# EasyEDA Pro project AHAU_CTF26_BAdge.epro

# Schematic Schematic1
Board Name: Board1; Create Date: 2026-04-05; Page Name: P1; Project Name: AHAU_CTF26; Schematic Name: Schematic1; Update Date: 2026-04-05; Company: EasyEDA.com; Page Size: A4; Version: V1.0
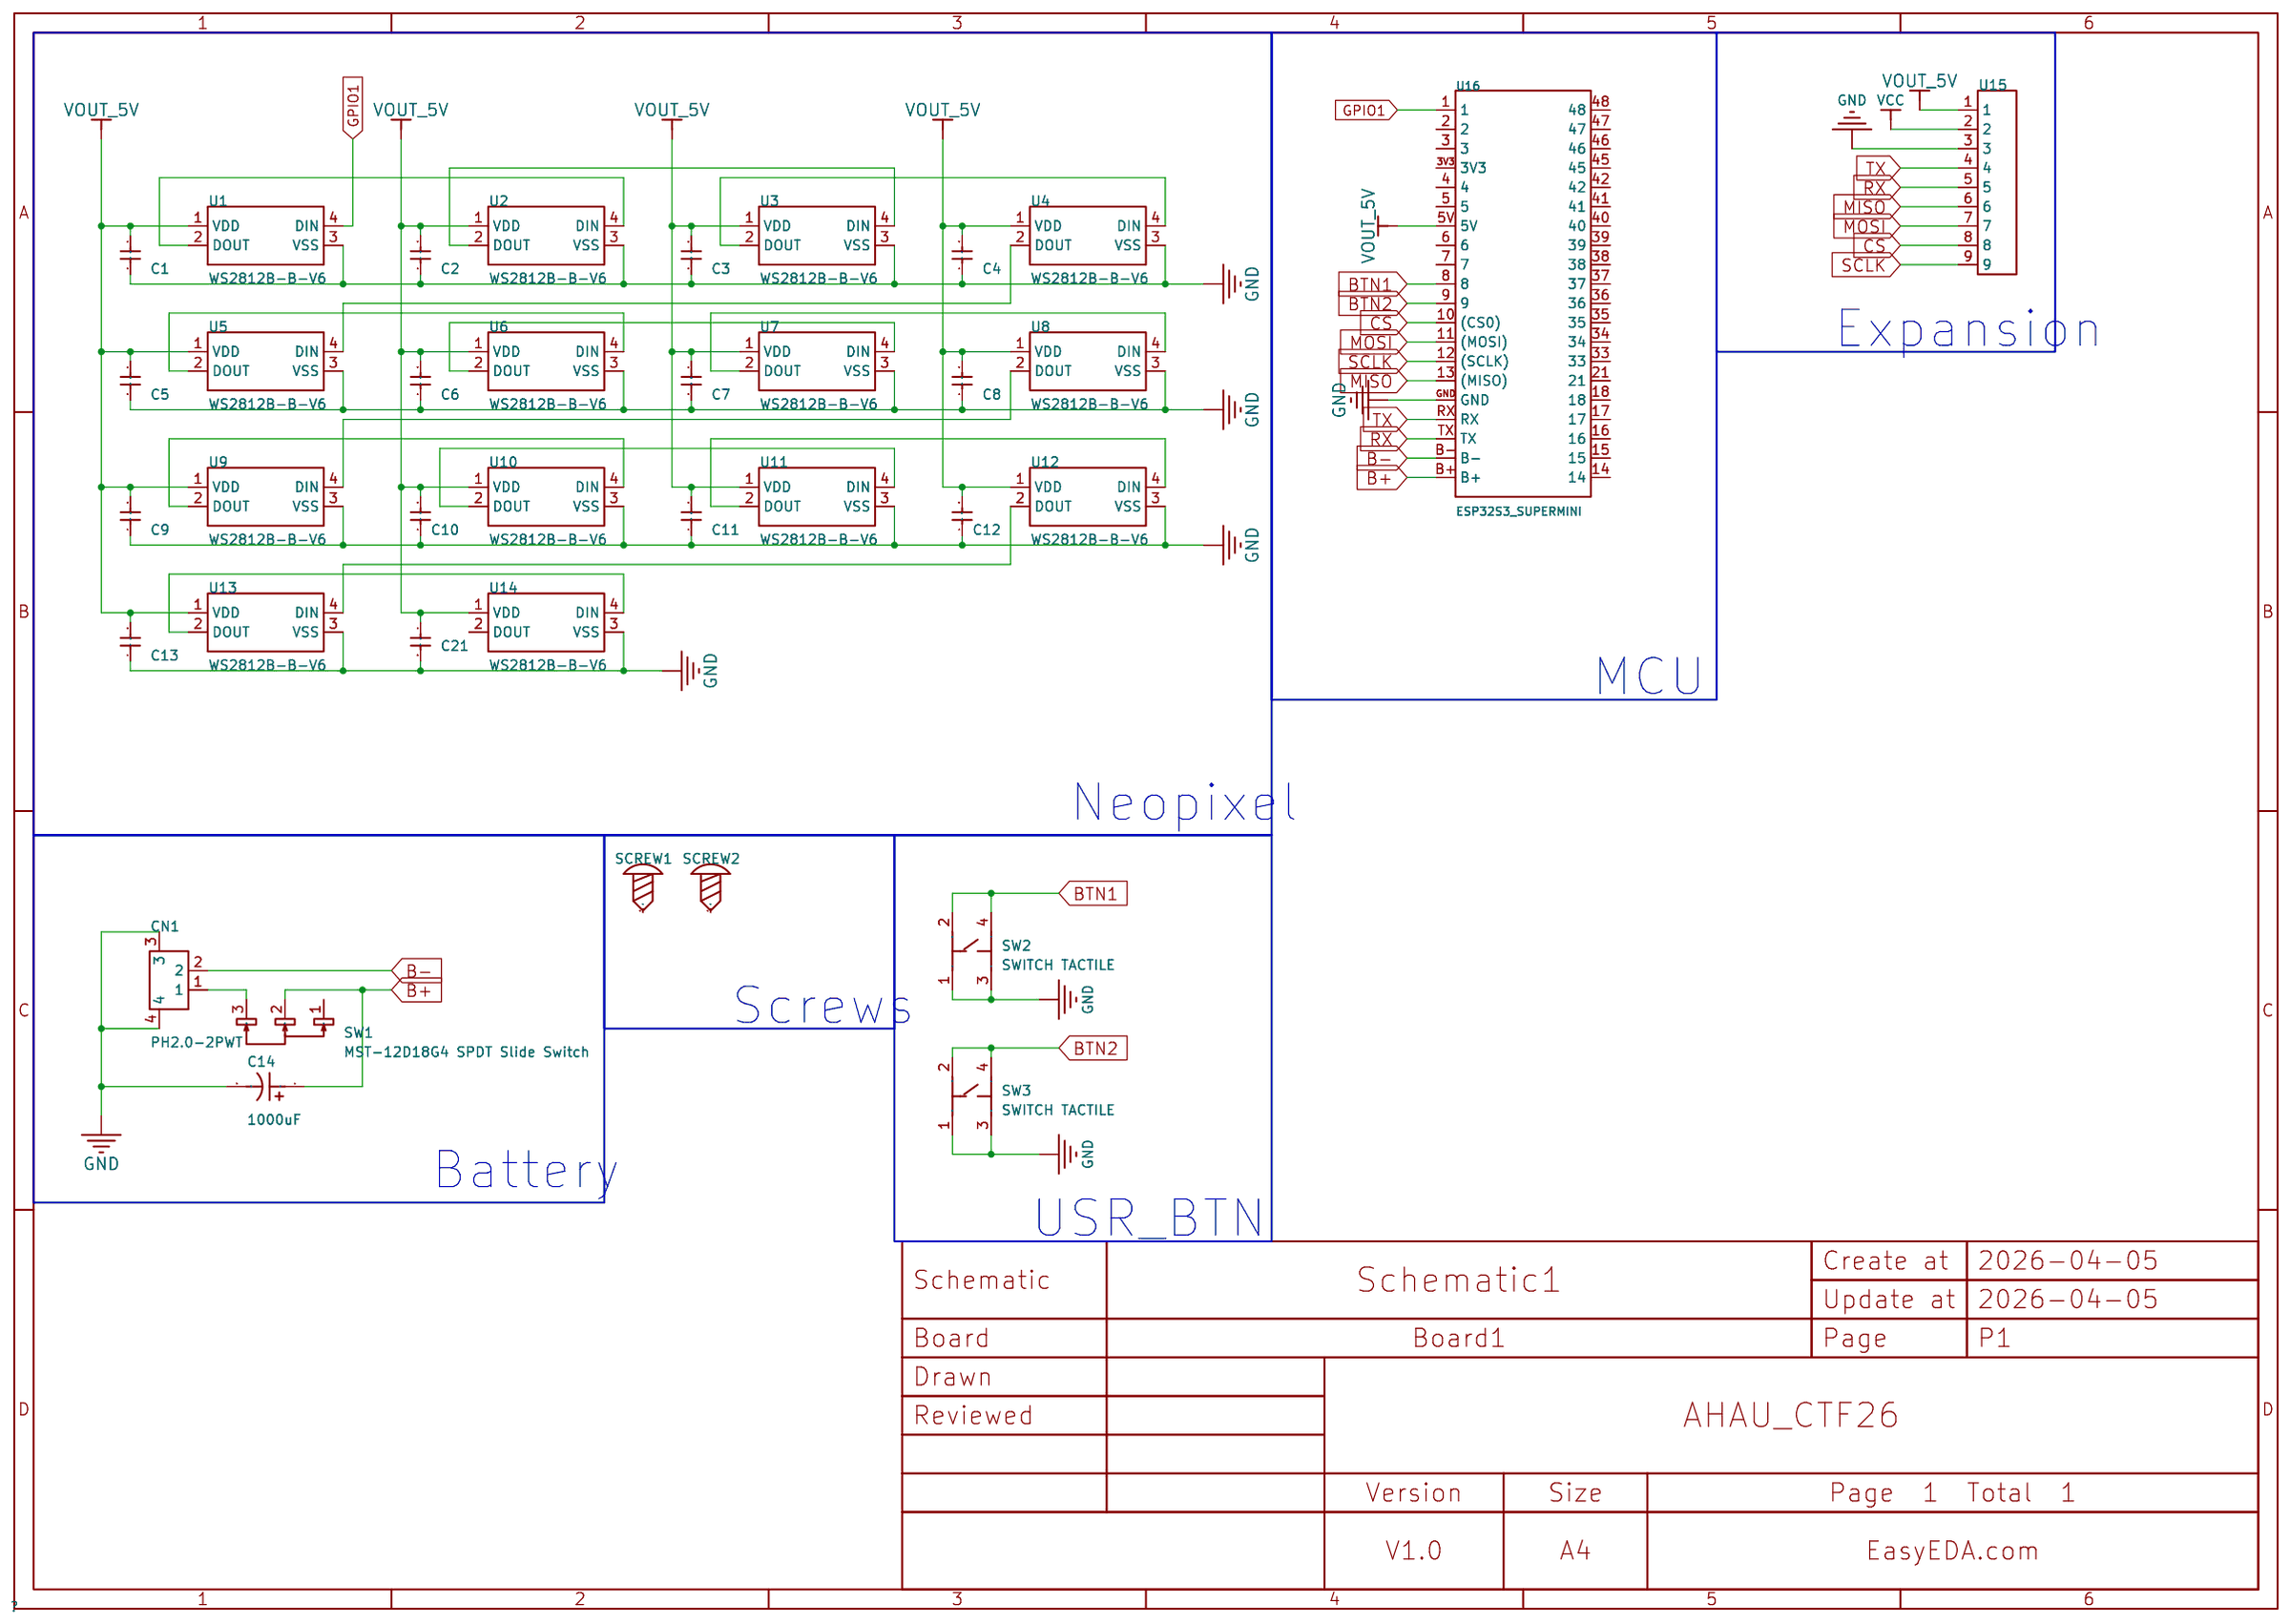
[diagram p0: schematic sheet]

## Parts
C1  1uF  [C0603]
C2  1uF  [C0603]
C3  1uF  [C0603]
C4  1uF  [C0603]
C5  1uF  [C0603]
C6  1uF  [C0603]
C7  1uF  [C0603]
C8  1uF  [C0603]
C9  1uF  [C0603]
C10  1uF  [C0603]
C11  1uF  [C0603]
C12  1uF  [C0603]
C13  1uF  [C0603]
C14  1000uF  [CAP-SMD_BD12.5-L12.8-W12.8-LS13.5-FD]
C21  1uF  [C0603]
CN1  PH2.0-2PWT  [CONN-SMD_PH2.0-2PWT]
SCREW1  -  [M3 Hole]
SCREW2  -  [M3 Hole]
SW1  MST-12D18G4 SPDT Slide Switch  [SW-SMD_MST-12D18G4-SPDT-SLIDE-SWITCH]
SW2  SWITCH TACTILE  [SW-SMD_4P-L5.2-W5.2-P3.7-LS6.4-1]
SW3  SWITCH TACTILE  [SW-SMD_4P-L5.2-W5.2-P3.7-LS6.4-1]
U1  WS2812B-B-V6  [LED-SMD_4P-L5.0-W5.0-TL_WS2812B-B]
U2  WS2812B-B-V6  [LED-SMD_4P-L5.0-W5.0-TL_WS2812B-B]
U3  WS2812B-B-V6  [LED-SMD_4P-L5.0-W5.0-TL_WS2812B-B]
U4  WS2812B-B-V6  [LED-SMD_4P-L5.0-W5.0-TL_WS2812B-B]
U5  WS2812B-B-V6  [LED-SMD_4P-L5.0-W5.0-TL_WS2812B-B]
U6  WS2812B-B-V6  [LED-SMD_4P-L5.0-W5.0-TL_WS2812B-B]
U7  WS2812B-B-V6  [LED-SMD_4P-L5.0-W5.0-TL_WS2812B-B]
U8  WS2812B-B-V6  [LED-SMD_4P-L5.0-W5.0-TL_WS2812B-B]
U9  WS2812B-B-V6  [LED-SMD_4P-L5.0-W5.0-TL_WS2812B-B]
U10  WS2812B-B-V6  [LED-SMD_4P-L5.0-W5.0-TL_WS2812B-B]
U11  WS2812B-B-V6  [LED-SMD_4P-L5.0-W5.0-TL_WS2812B-B]
U12  WS2812B-B-V6  [LED-SMD_4P-L5.0-W5.0-TL_WS2812B-B]
U13  WS2812B-B-V6  [LED-SMD_4P-L5.0-W5.0-TL_WS2812B-B]
U14  WS2812B-B-V6  [LED-SMD_4P-L5.0-W5.0-TL_WS2812B-B]
U15  -  [HDR-TH_9P-P2.54-V-M]
U16  ESP32S3_SUPERMINI  [ESP32-S3-SUPERMINI]

## Library data of the parts
C1-C13 C21 = C1uF: Capacitance:1uF Tolerance:±10% Tolerance:±10% Voltage Rated:50V Temperature Coefficient:X5R; LCSC Part Name: 1uF ±10% 50V; Supplier Part: C15849; Manufacturer: SAMSUNG(三星); Manufacturer Part: CL10A105KB8NNNC; Supplier Footprint: 0603; JLCPCB Part Class: Basic Part; Datasheet: https://atta.szlcsc.com/upload/public/pdf/source/20160103/1457707679084.pdf; Supplier: LCSC; Tolerance: ±10%; Voltage Rated: 50V; Temperature Coefficient: X5R
C14 = EDH108M025A9RAA: Capacitance:1000uF Tolerance:±20% Tolerance:±20% Voltage Rating:25V Ripple Current:510mA@120Hz Diameter:12.5mm Lifetime:2000hrs@105℃ Operating Temperature:-40℃~+105℃ Operating Temperature:-40℃~+105℃ Polarity type:有极性; LCSC Part Name: 1000uF ±20% 25V; Supplier Part: C2166241; Manufacturer: KEMET(基美); Supplier Footprint: SMD; JLCPCB Part Class: Extended Part; Datasheet: https://item.szlcsc.com/datasheet/EDH108M025A9RAA/2258293.html; Supplier: LCSC; Tolerance: ±20%; Voltage Rating: 25V; Ripple Current: 510mA@120Hz; Diameter: 12.5mm; Lifetime: 2000hrs@105℃; Operating Temperature: -40℃~+105℃; Polarity type: 有极性
CN1 = PH2.0-2PWT: Pins Structure:1x2P Pitch:2mm Mounting Type:Surface Mount, Right Angle Reference Series:PH Number of Pins:2P Number of Rows:1 Number of PINs Per Row:2 Current Rating:2A Contact Material:Brass Contact Plating:Tin Operating Temperature:-40℃~+85℃ Operating T; LCSC Part Name: 1x2P 间距:2mm 卧贴 系列:PH; Supplier Part: C52037422; Manufacturer: XUNPU(讯普); Supplier Footprint: SMD,P=2mm,卧贴; JLCPCB Part Class: Extended Part; Datasheet: https://item.szlcsc.com/datasheet/PH2.0-2PWT/54795753.html; Supplier: LCSC; Pins Structure: 1x2P; Pitch: 2mm; Mounting Type: Surface Mount, Right Angle; Reference Series: PH; Number of Pins: 2P; Number of Rows: 1; Number of PINs Per Row: 2; Current Rating: 2A; Contact Material: Brass; Contact Plating: Tin; Operating Temperature: -40℃~+85℃; Voltage Rating: 100V; Plastic Material: LCP; Flame Retardant Rating: UL94V-0; Supplementary Features: Auxiliary Solder Pin; Color: Beige; Z-Height of the Board: 5.5mm; X-Length of Bottom Edge on Board (Spacing Line): 7.9mm; Y-Width of Bottom Edge on Board: 7.6mm
SCREW1 SCREW2 = Screw-Hole-M3: Supplier Footprint: 插件
SW1 = MST-12D18G4 SPDT Slide Switch: Circuit:SPDT Actuator Style:Rectangular Columnar Termination Style:SMD(SMT) Tab Length:9.1mm Width:3.5mm Switch Height:7.5mm Mounting Type:Surface Mount, Right Angle Actuator Color:Black Current Rating:100mA Voltage Rating:12V Life:10,000 Cycles Operating; LCSC Part Name: MST-12D18G4卧式带柱编带; Supplier Part: C49023767; Manufacturer: SHOU HAN(首韩); Supplier Footprint: SMD; JLCPCB Part Class: Extended Part; Datasheet: https://item.szlcsc.com/datasheet/MST-12D18G4%2520SPDT%2520Slide%2520Switch/51384142.html; Supplier: LCSC; Circuit: SPDT; Actuator Style: Rectangular Columnar; Termination Style: SMD(SMT) Tab; Length: 9.1mm; Width: 3.5mm; Switch Height: 7.5mm; Mounting Type: Surface Mount, Right Angle; Actuator Color: Black; Current Rating: 100mA; Voltage Rating: 12V; Life: 10,000 Cycles; Operating Temperature: -25℃~+70℃
SW2 SW3 = HX 5.2x5.2x1.5H SWITCH TACTILE: Circuit:SPST Actuator Style:Round Button Operating Force:2.5N Mounting Type:Surface Mount,Vertical Length:5.2mm Width:5.2mm Switch Height:1.5mm with Bracket:Without Bracket Contact Current:50mA Voltage Rating:12V Actuator/Cap Color:Yellow With Lamp:No IP; LCSC Part Name: 5.2*5.2*1.5mm 立贴 轻触开关; Supplier Part: C49234130; Manufacturer: hanxia(韩下); Supplier Footprint: SMD; JLCPCB Part Class: Extended Part; Datasheet: https://item.szlcsc.com/datasheet/HX%25205.2x5.2x1.5H%2520SWITCH%2520TACTILE/51650191.html; Supplier: LCSC; Circuit: SPST; Actuator Style: Round Button; Operating Force: 2.5N; Mounting Type: Surface Mount,Vertical; Length: 5.2mm; Width: 5.2mm; Switch Height: 1.5mm; with Bracket: Without Bracket; Contact Current: 50mA; Voltage Rating: 12V; Actuator/Cap Color: Yellow; With Lamp: No; Termination Style: SMD(SMT) Tab; Life: 100,000 Cycles
U1-U14 = WS2812B-B-V6: Supplier Part: C52941391; Manufacturer: worldsemi; Supplier Footprint: SMD5050-4P; JLCPCB Part Class: Extended Part; Datasheet: https://item.szlcsc.com/datasheet/WS2812B-B-V6/55856754.html; Supplier: LCSC
U15 = Header9P_2.54
U16 = ESP32S3_SUPERMINI: esp32 s3 supermini with all of the pins; link: https://www.aliexpress.com/item/1005006838192160.html?src=google&src=google&albch=shopping&acnt=494-037-6276&isdl=y&slnk=&plac=&mtctp=&albbt=Google_7_shopping&aff_platform=google&aff_short_key=UneMJZVf&gclsrc=aw.ds&&albagn=888888&&ds_e_adid=&ds_e_matchtype=&ds_e_device=c&ds_e_network=x&ds_e_product_group_id=&ds_e_product_id=en1005006838192160&ds_e_product_merchant_id=106274268&ds_e_product_country=GB&ds_e_product_language=en&ds_e_product_channel=online&ds_e_product_store_id=&ds_url_v=2&albcp=17859500389&albag=&isSmbAutoCall=false&needSmbHouyi=false&gad_source=1&gclid=CjwKCAjw_4S3BhAAEiwA_64Yhu-4cWOcr4zIoMMT86tg_DvZlKA97rwpv0V6Q1grb6KFBap-yB5T3hoCvMkQAvD_BwE

## Nets
GND: C1.1 C2.1 C3.1 C4.1 C5.1 C6.1 C7.1 C8.1 C9.1 C10.1 C11.1 C12.1 C13.1 C14.2 C21.2 CN1.3 CN1.4 SW2.1 SW2.3 SW3.1 SW3.3 U1.3(VSS) U2.3(VSS) U3.3(VSS) U4.3(VSS) U5.3(VSS) U6.3(VSS) U7.3(VSS) U8.3(VSS) U9.3(VSS) U10.3(VSS) U11.3(VSS) U12.3(VSS) U13.3(VSS) U14.3(VSS) U15.3 U16.GND
VCC: U15.2
B+: C14.1 SW1.2 U16.B+
B-: CN1.2 U16.B-
BTN1: SW2.2 SW2.4 U16.8
BTN2: SW3.2 SW3.4 U16.9
CS: U15.8 U16.10((CS0))
GPIO1: U1.4(DIN) U16.1
MISO: U15.6 U16.13((MISO))
MOSI: U15.7 U16.11((MOSI))
RX: U15.5 U16.TX
SCLK: U15.9 U16.12((SCLK))
TX: U15.4 U16.RX
VOUT_5V: C1.2 C2.2 C3.2 C4.2 C5.2 C6.2 C7.2 C8.2 C9.2 C10.2 C11.2 C12.2 C13.2 C21.1 U1.1(VDD) U2.1(VDD) U3.1(VDD) U4.1(VDD) U5.1(VDD) U6.1(VDD) U7.1(VDD) U8.1(VDD) U9.1(VDD) U10.1(VDD) U11.1(VDD) U12.1(VDD) U13.1(VDD) U14.1(VDD) U15.1 U16.5V
$1N5915: U12.2(DOUT) U13.4(DIN)
$1N5955: U1.2(DOUT) U2.4(DIN)
$1N6010: U2.2(DOUT) U3.4(DIN)
$1N6017: U3.2(DOUT) U4.4(DIN)
$1N6025: U4.2(DOUT) U5.4(DIN)
$1N6060: U5.2(DOUT) U6.4(DIN)
$1N6067: U6.2(DOUT) U7.4(DIN)
$1N6075: U7.2(DOUT) U8.4(DIN)
$1N6093: U8.2(DOUT) U9.4(DIN)
$1N6102: U9.2(DOUT) U10.4(DIN)
$1N6109: U10.2(DOUT) U11.4(DIN)
$1N6116: U11.2(DOUT) U12.4(DIN)
$1N6127: U13.2(DOUT) U14.4(DIN)
$1N6131: CN1.1 SW1.3

Not connected (* = marked no-connect by the designer): SCREW1 1; SCREW2 1; SW1 1; U14 2(DOUT); U16 2 3 3V3 4 5 6 7 14 15 16 17 18 21 33 34 35 36 37 38 39 40 41 42 45 46 47 48

## Notes on the sheet
- Expansion
- MCU
- Neopixel
- Screws
- Battery
- USR_BTN

# Board PCB2
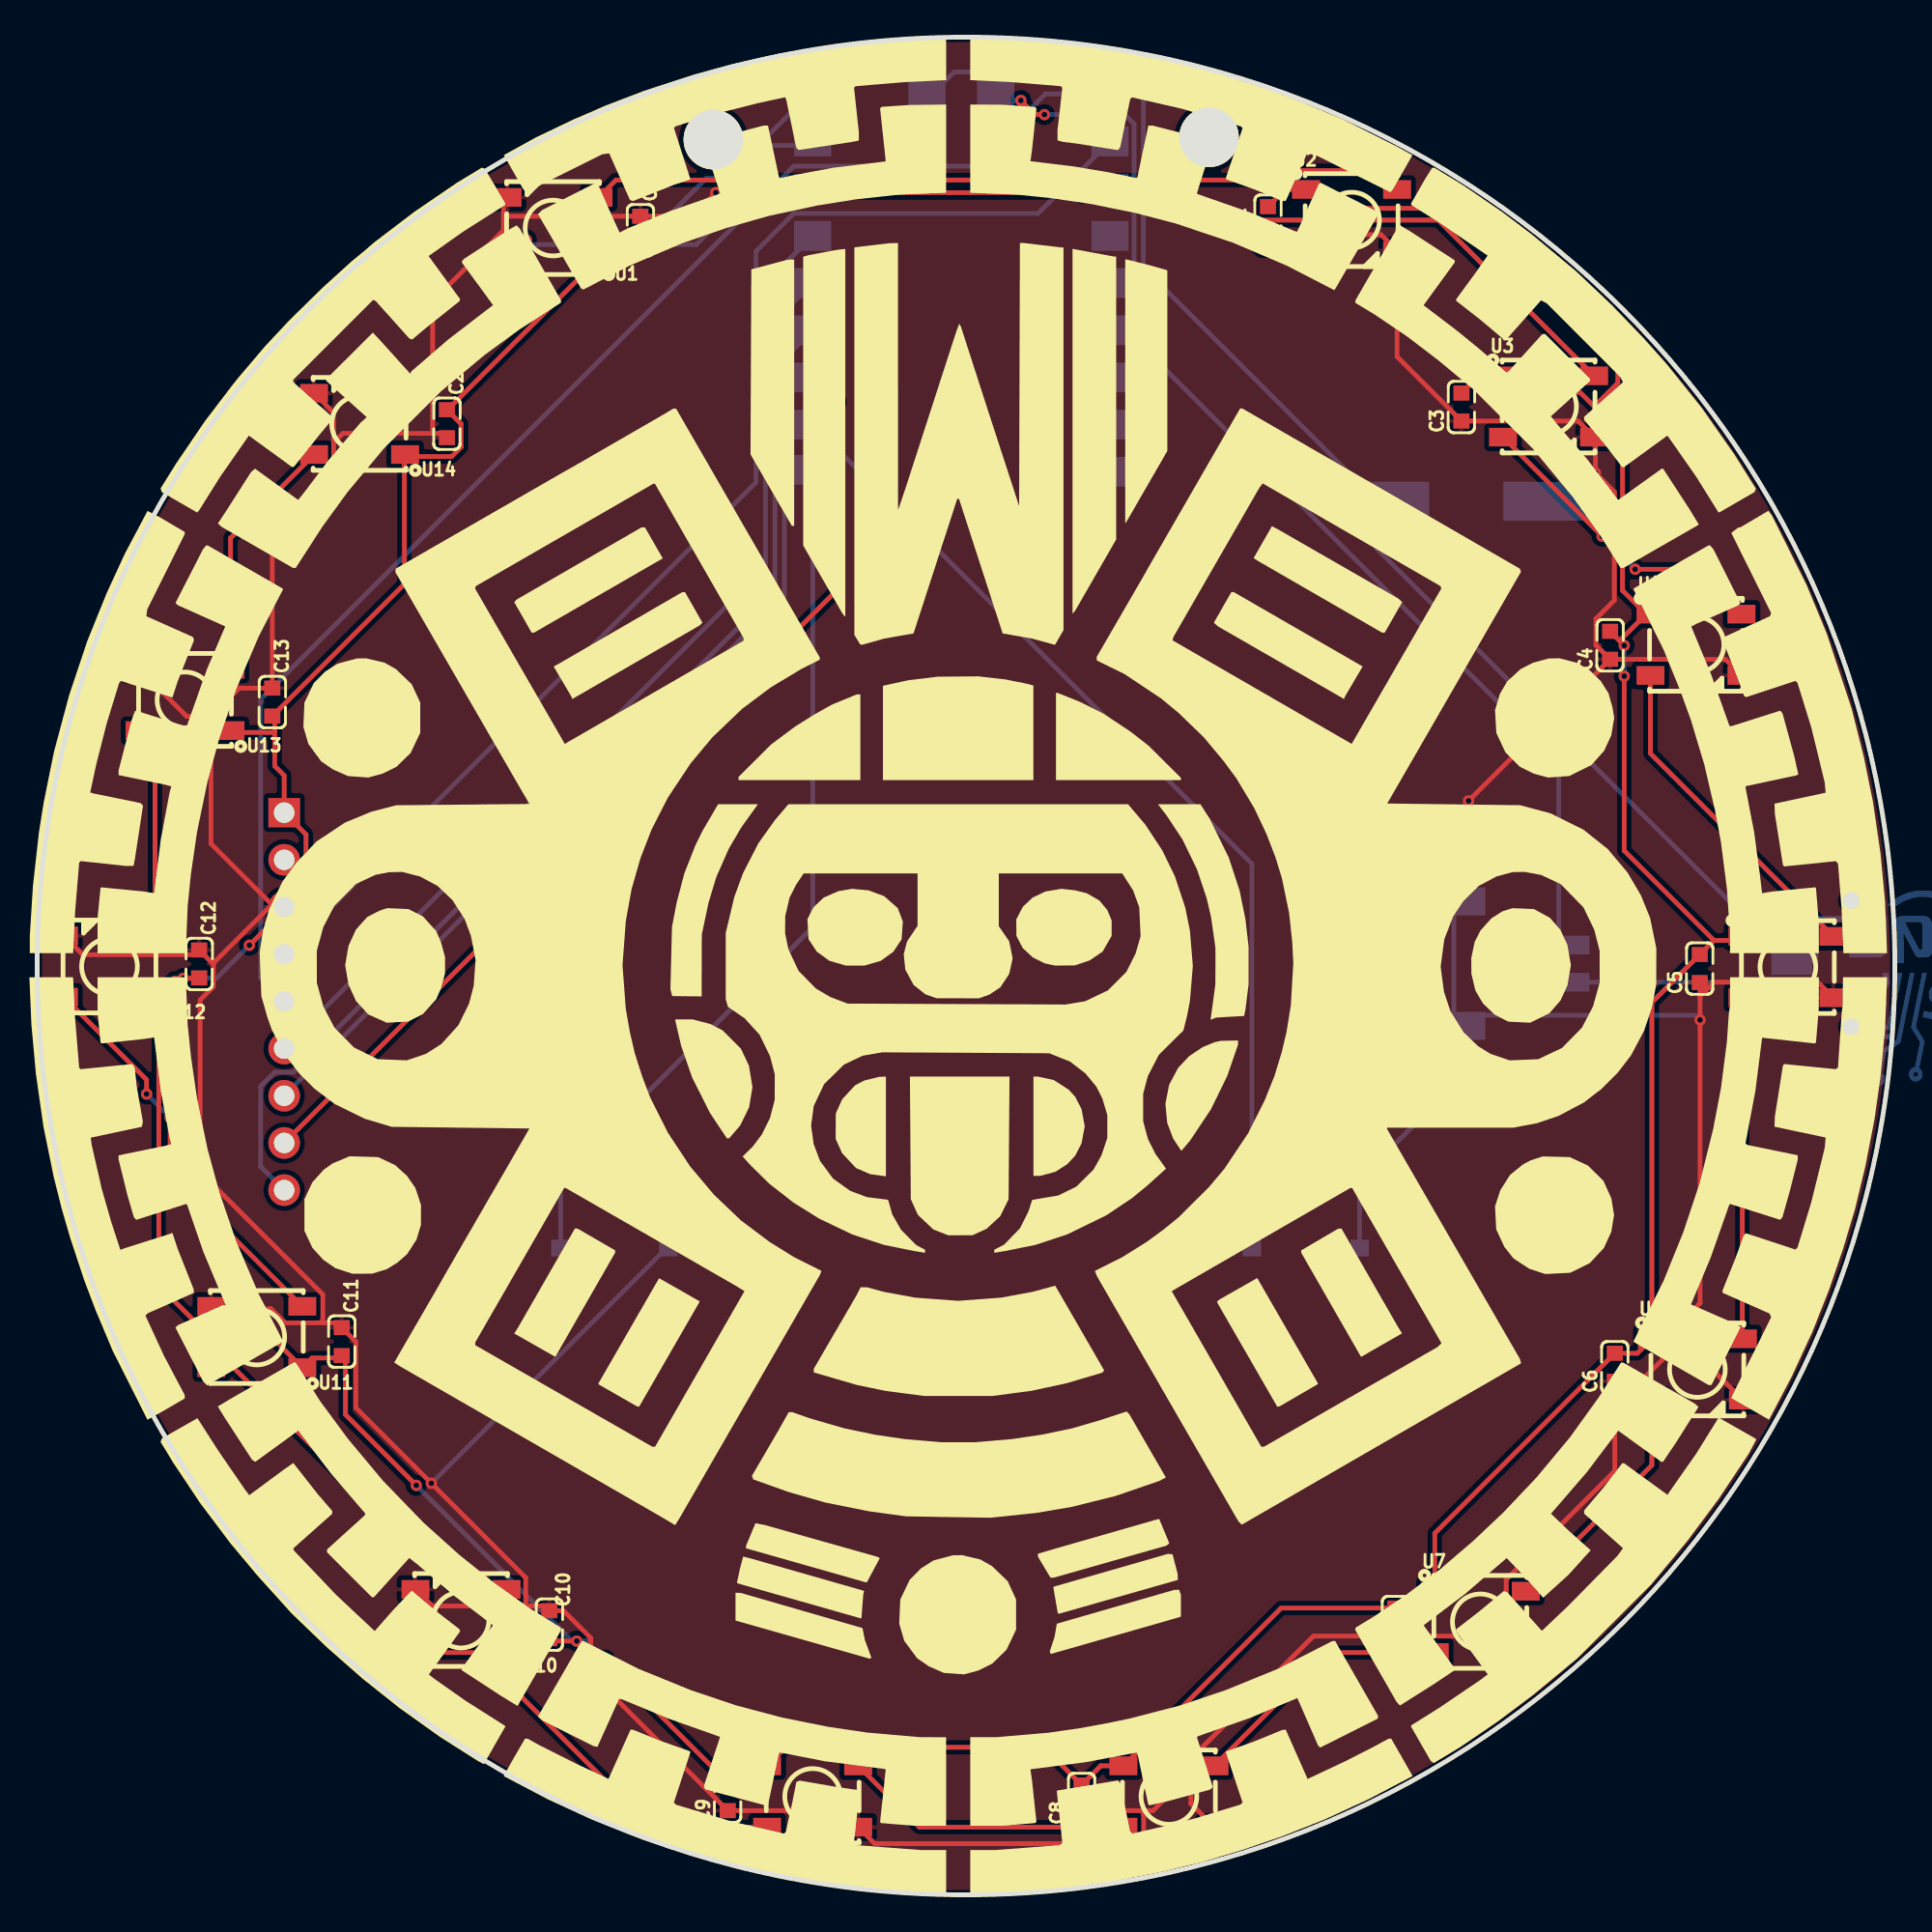
[diagram p1: board, top side]
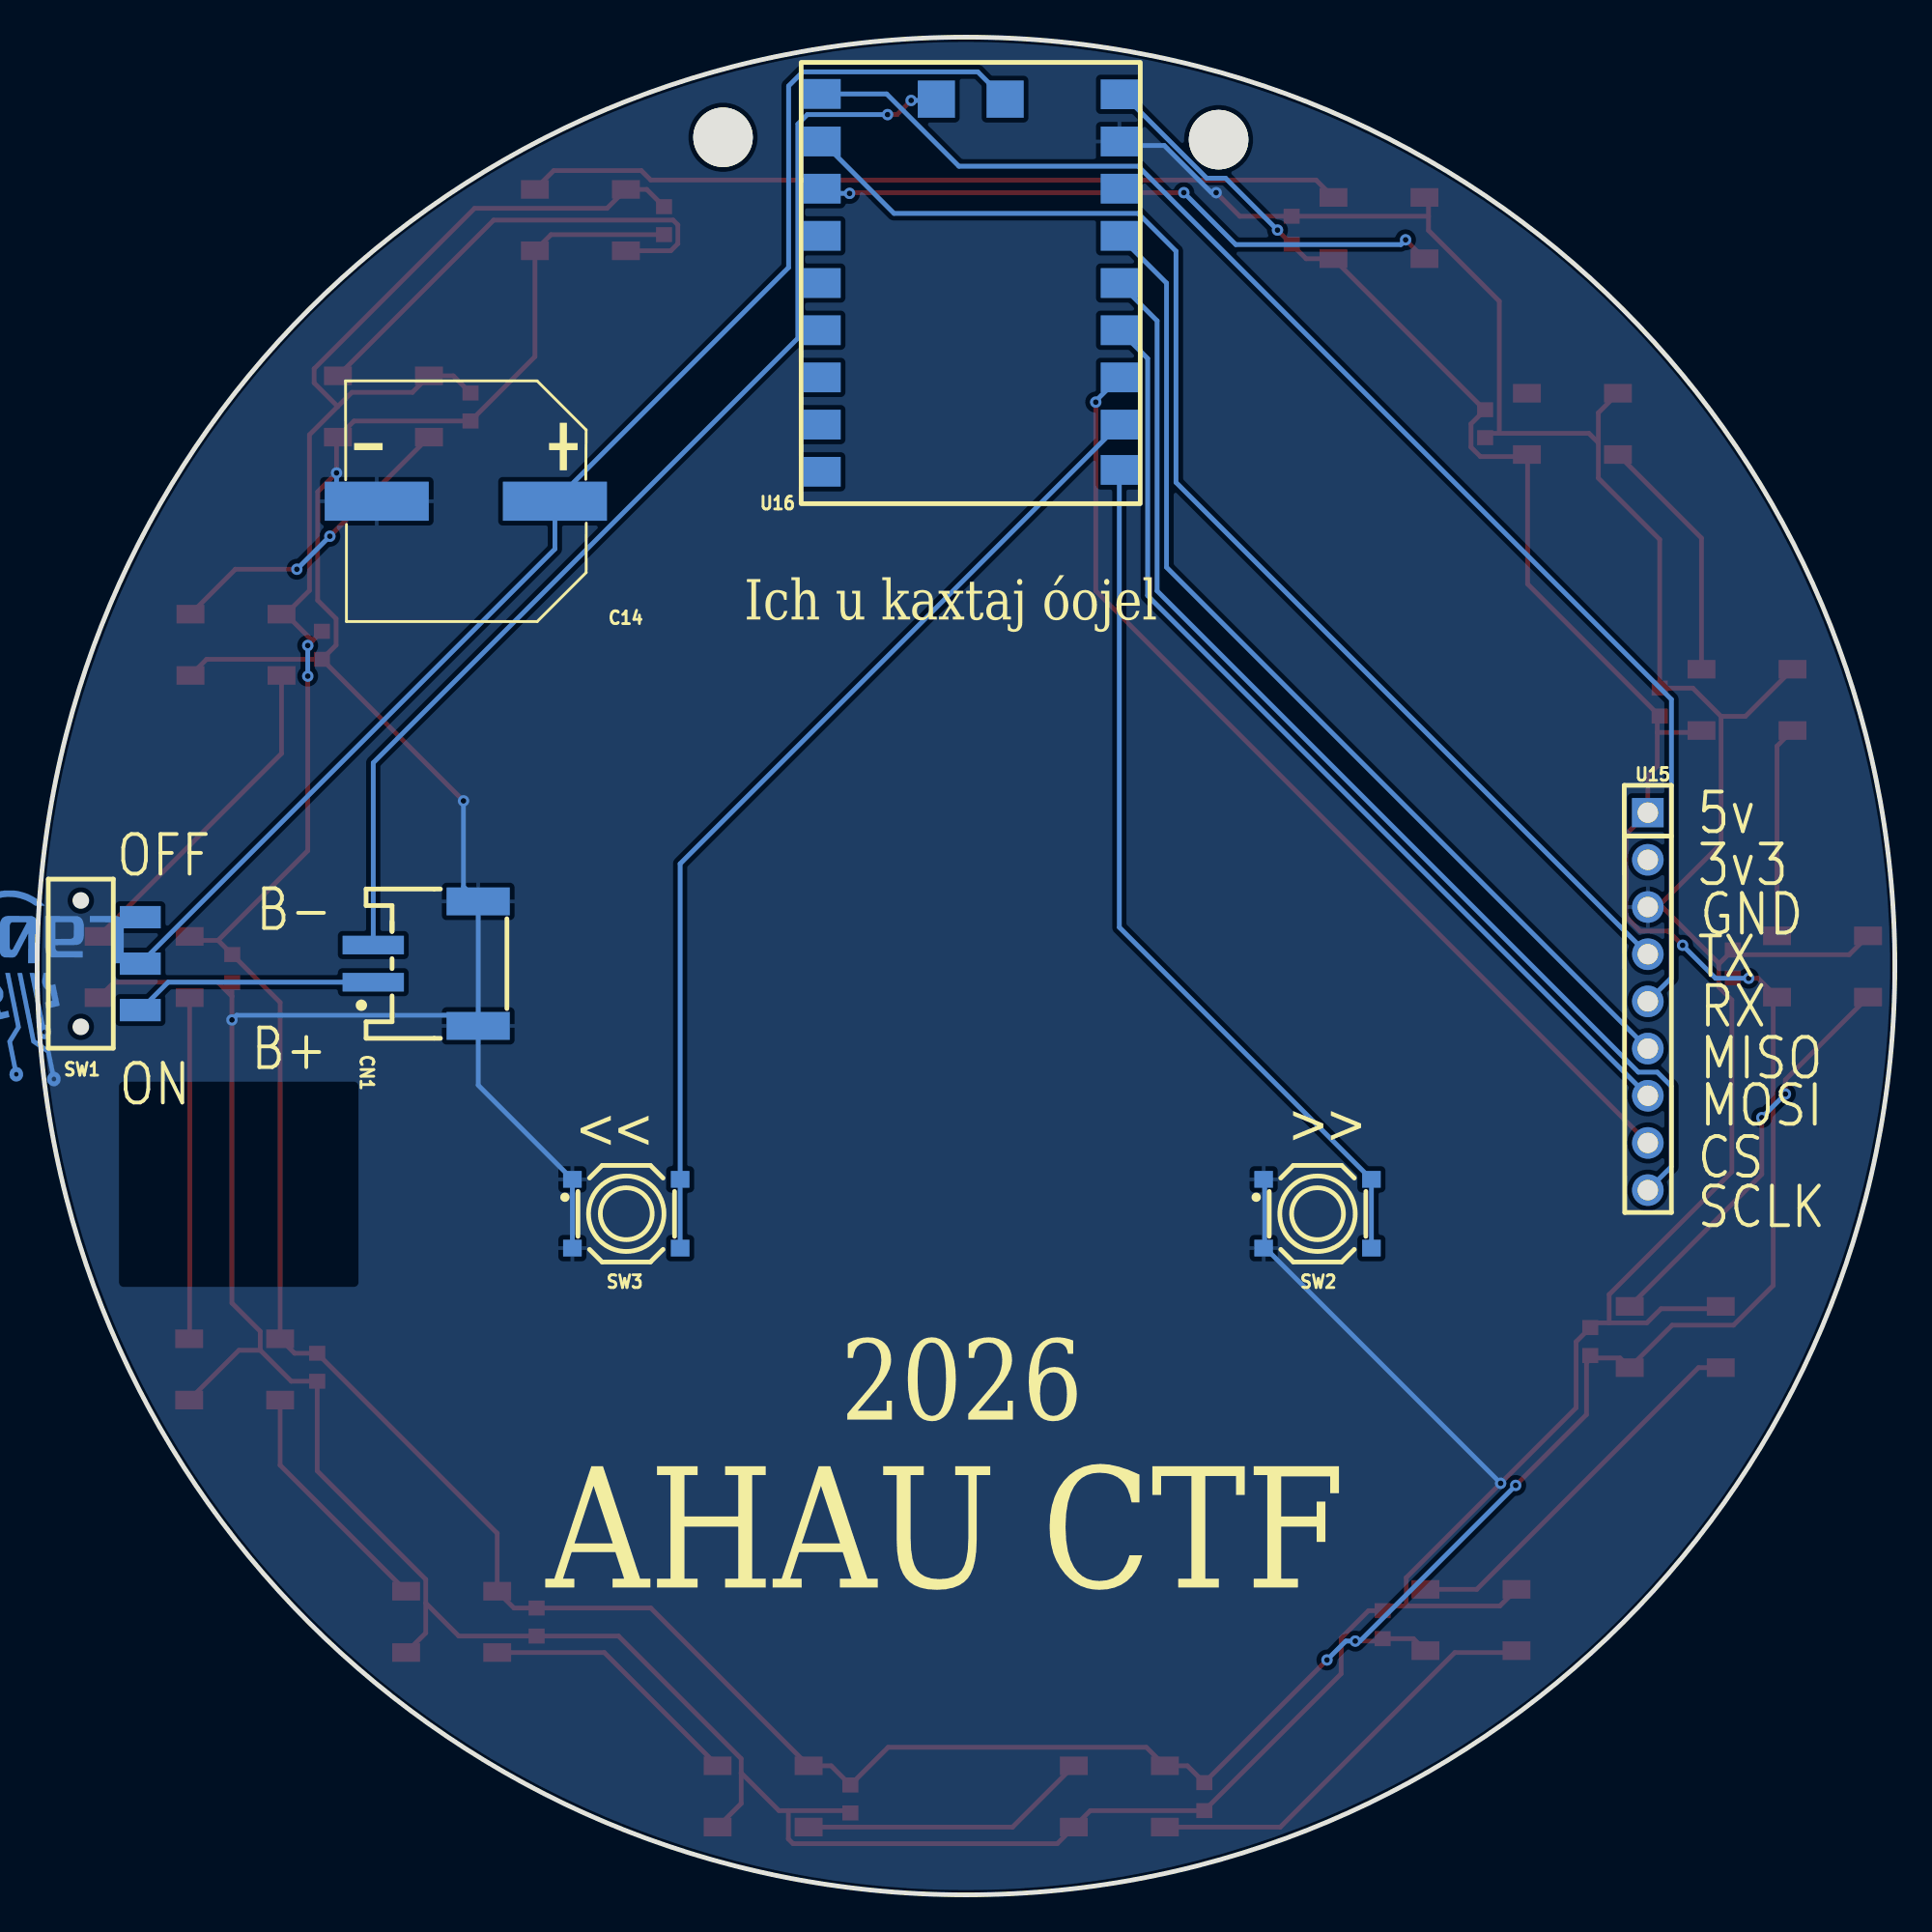
[diagram p2: board, bottom side, seen from below]

Outline 100 x 100 mm; copper layers: Top Layer, Bottom Layer. Coordinates in mm from the lower left corner of the outline.
Outline path: circle c50,50 r50
Stack: Top Layer 0.035mm / Dielectric1 1.51mm FR4 er 4.5 / Bottom Layer 0.035mm

## Design rules (mm)
spacing copperThickness1oz (default): track to track 0.102, other pairs 0.152 to 0.3
spacing copperThickness2oz: track to track 0.203, other pairs 0.152 to 0.3
spacing Plane_innerPlane: track to track 0.102, other pairs 0.152 to 0.3
spacing Copper_copperRegion: track to track 0.102, other pairs 0.152 to 0.3
track width copperThickness1oz (default): min 0.127, default 0.254, max 2.54
track width copperThickness2oz: min 0.203, default 0.254, max 2.54
differential pair differentialPair (default): width min 0.127, default 0.254, max 2.54; gap min 0.152, default 0.152
net VOUT_5V uses Copper_copperRegion, Plane_innerPlane
net GND uses Copper_copperRegion, Plane_innerPlane
net GPIO1 uses Copper_copperRegion, Plane_innerPlane
net $1N5955 uses Copper_copperRegion, Plane_innerPlane
net $1N6010 uses Copper_copperRegion, Plane_innerPlane
net $1N6017 uses Copper_copperRegion, Plane_innerPlane
net $1N6025 uses Copper_copperRegion, Plane_innerPlane
net $1N6060 uses Copper_copperRegion, Plane_innerPlane
net $1N6067 uses Copper_copperRegion, Plane_innerPlane
net $1N6075 uses Copper_copperRegion, Plane_innerPlane
net $1N6093 uses Copper_copperRegion, Plane_innerPlane
net $1N6102 uses Copper_copperRegion, Plane_innerPlane
net $1N6109 uses Copper_copperRegion, Plane_innerPlane
net $1N6116 uses Copper_copperRegion, Plane_innerPlane
net $1N5915 uses Copper_copperRegion, Plane_innerPlane
pour e159 uses Copper_copperRegion
pour e197 uses Copper_copperRegion

## Placement (name value [footprint] x y rotation side)
C1  1uF  [C0603]  32.47 90.36 270 top
C2  1uF  [C0603]  66.26 89.37 90 top
C3  1uF  [C0603]  76.67 79.34 90 top
C4  1uF  [C0603]  84.67 66.51 90 top
C5  1uF  [C0603]  89.5 49.11 90 top
C6  1uF  [C0603]  84.93 27.65 90 top
C7  1uF  [C0603]  73.11 13.93 90 top
C8  1uF  [C0603]  56.22 4.41 90 top
C9  1uF  [C0603]  37.17 4.53 90 top
C10  1uF  [C0603]  27.57 15.3 270 top
C11  1uF  [C0603]  16.39 30.54 270 top
C12  1uF  [C0603]  8.72 50.86 270 top
C13  1uF  [C0603]  12.66 64.96 270 top
C14  1000uF  [CAP-SMD_BD12.5-L12.8-W12.8-LS13.5-FD]  76.92 75.02 0 bottom
C21  1uF  [C0603]  22.06 79.94 270 top
CN1  PH2.0-2PWT  [CONN-SMD_PH2.0-2PWT]  79.08 50.13 90 bottom
SCREW1  -  [M3 Hole]  63.14 94.55 0 top
SCREW2  -  [M3 Hole]  36.47 94.42 0 top
SW1  MST-12D18G4 SPDT Slide Switch  [SW-SMD_MST-12D18G4-SPDT-SLIDE-SWITCH]  94.45 50.13 270 bottom
SW2  SWITCH TACTILE  [SW-SMD_4P-L5.2-W5.2-P3.7-LS6.4-1]  31.08 36.67 180 bottom
SW3  SWITCH TACTILE  [SW-SMD_4P-L5.2-W5.2-P3.7-LS6.4-1]  68.29 36.67 180 bottom
U1  WS2812B-B-V6  [LED-SMD_4P-L5.0-W5.0-TL_WS2812B-B]  27.77 89.72 180 top
U2  WS2812B-B-V6  [LED-SMD_4P-L5.0-W5.0-TL_WS2812B-B]  70.76 90.15 0 top
U3  WS2812B-B-V6  [LED-SMD_4P-L5.0-W5.0-TL_WS2812B-B]  81.36 80.12 0 top
U4  WS2812B-B-V6  [LED-SMD_4P-L5.0-W5.0-TL_WS2812B-B]  89.3 67.29 0 top
U5  WS2812B-B-V6  [LED-SMD_4P-L5.0-W5.0-TL_WS2812B-B]  94.24 49.94 0 top
U6  WS2812B-B-V6  [LED-SMD_4P-L5.0-W5.0-TL_WS2812B-B]  89.37 28.28 0 top
U7  WS2812B-B-V6  [LED-SMD_4P-L5.0-W5.0-TL_WS2812B-B]  77.69 14.69 0 top
U8  WS2812B-B-V6  [LED-SMD_4P-L5.0-W5.0-TL_WS2812B-B]  60.92 5.3 0 top
U9  WS2812B-B-V6  [LED-SMD_4P-L5.0-W5.0-TL_WS2812B-B]  41.75 5.3 0 top
U10  WS2812B-B-V6  [LED-SMD_4P-L5.0-W5.0-TL_WS2812B-B]  22.82 14.79 180 top
U11  WS2812B-B-V6  [LED-SMD_4P-L5.0-W5.0-TL_WS2812B-B]  11.82 30.03 180 top
U12  WS2812B-B-V6  [LED-SMD_4P-L5.0-W5.0-TL_WS2812B-B]  3.89 49.97 180 top
U13  WS2812B-B-V6  [LED-SMD_4P-L5.0-W5.0-TL_WS2812B-B]  7.96 64.32 180 top
U14  WS2812B-B-V6  [LED-SMD_4P-L5.0-W5.0-TL_WS2812B-B]  17.36 79.18 180 top
U15  -  [HDR-TH_9P-P2.54-V-M]  13.3 46.83 270 bottom
U16  ESP32S3_SUPERMINI  [ESP32-S3-SUPERMINI]  49.75 98.51 180 bottom

## Footprints (pads in the part's own frame, mm; a bottom-side part is the same pattern mirrored in y, then rotated)
C0603
  rect 0.807x0.864 smd: 1(0,0) 2(1.506,0)
CAP-SMD_BD12.5-L12.8-W12.8-LS13.5-FD
  rect 5.6x2.1 smd: 1(-4.795,0) 2(4.795,0)
CONN-SMD_PH2.0-2PWT
  rect 1x3.3 smd: 1(-1,2.825) 2(1,2.825)
  rect 1.5x3.4 smd: 3(3.35,-2.825) 4(-3.35,-2.825)
ESP32-S3-SUPERMINI
  rect 2x1.6 smd: 1(-8,-6.67) 2(-8,-9.21) 3(-8,-11.75) 3V3(8,-6.67) 4(-8,-14.29) 5(-8,-16.83) 5V(8,-1.59) 6(-8,-19.37) 7(-8,-21.91) 8(8,-21.81) 9(8,-19.37) 10(8,-16.83) 11(8,-14.29) 12(8,-11.75) 13(8,-9.21) GND(8,-4.13) RX(-8,-4.13) TX(-8,-1.57)
  rect 2x2 smd: B+(1.85,-1.85) B-(-1.85,-1.85)
HDR-TH_9P-P2.54-V-M
  rect 1.575x1.7 hole 1.1: 1(-11.43,0)
  round 1.7 hole 1.1: 2(-8.89,0) 3(-6.35,0) 4(-3.81,0) 5(-1.27,0) 6(1.27,0) 7(3.81,0) 8(6.35,0) 9(8.89,0)
LED-SMD_4P-L5.0-W5.0-TL_WS2812B-B
  rect 1.5x1 smd: 1(-2.45,1.65) 2(-2.45,-1.65) 3(2.45,-1.65) 4(2.45,1.65)
M3 Hole
  round 3.2 hole 3.2: 1(-0.064,0.064)
SW-SMD_4P-L5.2-W5.2-P3.7-LS6.4-1
  rect 1x0.9 smd: 1(-2.9,1.85) 2(2.9,1.85) 3(-2.9,-1.85) 4(2.9,-1.85)
SW-SMD_MST-12D18G4-SPDT-SLIDE-SWITCH
  rect 1.2x2.2 smd: 1(-2.5,0) 2(0,0) 3(2.5,0)

## Nets
As in the schematic.

Pads without a net: SCREW1 1; SCREW2 1; SW1 1; U14 2; U16 2 3 3V3 4 5 6 7

## Via types
v1: diameter 0.61, hole 0.305, Top Layer to Bottom Layer, 23 vias

## Routing (per net, layer and track width the routed paths; a pad name or vN(x,y) marks a point on that pad's centre or on a via; arc(x,y) is an arc through that point)
GND: length 395.5
  Top Layer w0.254: 26.3,15.55 21.26,15.55 U10.3 ; 26.3,15.55 27.32,15.55 C10.1 28.33,15.3 29.81,13.82 29.81,11.9 C9.1 43.31,4.53 U9.3 45.09,2.76 59.31,2.76 59.56,3.01 59.56,4.53 ; 26.3,15.55 26.3,17.07 v1(21.22,22.15) 17.16,26.22 17.16,29.77 C11.1 16.14,30.79 15.38,30.79 ; 79.08,15.71 79.08,14.1 U7.3 ; 79.08,15.71 79.08,16.98 84.93,22.82 C6.1 86.32,27.65 87.99,29.32 ; 79.08,15.71 77.31,13.93 C7.1 68.71,13.93 62.1,7.33 62.1,6.57 ; 21.29,78.67 21.29,85.79 25.1,89.6 25.1,90.36 ; 21.29,78.67 16.47,78.67 15.96,78.17 ; 21.29,78.67 21.82,78.67 22.06,78.44 ; 25.1,90.36 C1.1 35.26,90.36 v1(36.53,91.63) ; 25.1,90.36 25.1,91.16 U1.3 ; 59.56,4.53 56.35,4.53 C8.1 ; 59.56,4.53 60.07,4.53 62.1,6.57 ; 12.76,53.17 12.51,53.17 9.48,50.15 9.48,50.1 ; 12.76,53.17 9.36,56.58 9.36,63.44 ; 12.76,53.17 U15.3 ; 89.51,48.37 v1(89.51,47.1) 89.51,31.86 87.99,30.33 87.99,29.32 ; 89.51,48.37 90.28,49.13 95.86,49.13 U5.3 ; 89.51,48.37 89.51,49.09 C5.1 ; 9.36,63.44 8.04,63.44 U13.3 ; 9.36,63.44 10.87,64.96 C13.1 12.66,72.96 15.96,76.26 15.96,78.17 ; 15.38,30.79 15.38,32.31 8.77,38.92 8.77,48.17 9.48,48.88 9.48,50.1 ; 15.38,30.79 13.35,30.79 12.58,31.55 9.5,31.55 U11.3 ; 15.96,78.17 15.96,79.78 14.91,80.83 ; U8.3 62.1,4.92 62.1,6.57 ; C4.1 90.88,66.51 91.75,65.64 ; C4.1 v1(77.05,58.89) ; C4.1 83.91,67.27 83.91,68.69 84.9,69.69 84.9,75.53 v1(83.88,76.54) 83.88,78.39 U3.3 82.94,79.34 C3.1 73.21,82.8 U2.3 72.34,89.37 C2.1 ; U6.3 89.14,29.32 87.99,29.32 ; 9.48,50.1 C12.1 8.47,50.61 2.46,50.61 U12.3
  Bottom Layer w0.254: CN1.4 CN1.3 77.05,54.27 v1(77.05,58.89) ; CN1.4 76.26,43.58 SW3.1 SW3.3 ; CN1.4 76.83,47.35 89.26,47.35 v1(89.51,47.1) ; v1(36.53,91.63) 36.79,91.63 39.33,94.17 41.53,94.17 U16.GND ; SW2.1 33.92,38.46 33.92,34.85 ; C14.2 83.12,75.02 83.88,75.78 v1(83.88,76.54) ; 33.92,34.85 v1(21.22,22.15) ; 33.92,34.85 SW2.3
B+: length 74.3
  Bottom Layer w0.254: U16.B+ 49.37,98.13 58.79,98.13 59.55,97.37 59.55,87.6 72.13,75.02 72.13,72.45 SW1.2
B-: length 61.7
  Top Layer w0.254: v1(54.22,95.83) 53.72,95.83 v1(52.95,96.59)
  Bottom Layer w0.254: v1(54.22,95.83) 58.54,95.83 59.05,95.32 59.05,83.8 81.91,60.94 CN1.2 ; U16.B- 51.67,96.59 v1(52.95,96.59)
BTN1: length 47.5
  Bottom Layer w0.254: U16.8 41.75,52.08 SW2.2 SW2.4
BTN2: length 54.1
  Bottom Layer w0.254: SW3.4 SW3.2 65.39,55.5 U16.9
CS: length 54
  Top Layer w0.254: v1(43.01,80.35) 43.01,70.19 U15.8
  Bottom Layer w0.254: v1(43.01,80.35) 43.01,80.42 U16.10
GPIO1: length 34.2
  Top Layer w0.254: U1.4 v1(26.34,89.09) ; v1(38.27,91.63) 56.23,91.63 v1(56.27,91.59)
  Bottom Layer w0.254: v1(56.27,91.59) 57.49,91.59 U16.1 ; v1(38.27,91.63) 35.48,88.84 26.59,88.84 v1(26.34,89.09)
MISO: length 55.5
  Bottom Layer w0.254: U16.13 39.21,86.76 39.21,71.46 U15.6
MOSI: length 53
  Bottom Layer w0.254: U15.7 40.22,69.94 40.22,82.7 U16.11
RX: length 76
  Bottom Layer w0.254: U15.5 12.03,49.36 12.03,64.35 40.73,93.05 50.38,93.05 54.27,96.94 U16.TX
SCLK: length 62.3
  Bottom Layer w0.254: U16.12 39.71,84.73 39.71,70.19 13.81,44.28 12.79,44.28 12.03,43.52 12.03,39.2 U15.9
TX: length 69.9
  Bottom Layer w0.254: U15.4 38.7,76.03 38.7,88.48 40.73,90.51 53.88,90.51 U16.RX
VOUT_5V: length 292.9
  Top Layer w0.254: 90.26,51.38 C5.2 86.92,48.04 U6.1 86.14,29.15 C6.2 75.24,19.47 U7.1 74.33,15.44 C7.2 66.96,15.44 U8.1 57.26,6.95 C8.2 54.19,7.94 40.29,7.94 U9.1 38.08,6.95 C9.2 v1(30.57,12.64) ; 90.26,51.38 91.58,51.38 U5.1 ; 90.26,51.38 85.43,56.2 v1(85.43,65.6) ; 83.82,80.12 85.09,81.39 85.09,82.15 76.45,90.79 69.32,90.79 U2.1 67.18,91.8 C2.2 ; 83.82,80.12 85.34,78.59 85.34,70.21 86.61,68.94 ; 83.82,80.12 83.06,80.88 79.8,80.88 78.91,81.77 77.6,81.77 C3.2 ; 85.18,67.51 86.61,68.94 ; 85.18,67.51 v1(85.43,67.25) ; 85.18,67.51 C4.2 ; 86.61,68.94 86.84,68.94 ; v1(11.42,51.12) 12.19,51.88 13.71,51.88 14.47,52.64 14.47,57.08 U15.1 13.3,60.25 12.79,60.76 12.79,62.57 ; 16.34,28.9 C11.2 ; 16.34,28.9 14.79,28.9 U11.1 11.99,30.66 8.68,30.66 6.55,32.8 6.55,48.12 U12.1 7.36,49.34 v1(7.87,49.34) 8.7,49.34 C12.2 ; 16.34,28.9 16.6,28.65 16.6,25.85 v1(20.41,22.04) ; U13.1 10.51,62.57 12.79,62.57 ; U10.1 25.91,13.79 C10.2 27.7,13.66 v1(29.04,13.66) ; v1(33.23,89.61) C1.2 31.69,88.07 U1.1 22.09,79.94 C21.1 22.82,79.18 22.82,77.93 22.31,77.42 19.77,77.42 ; 12.79,62.57 12.79,63.32 C13.2 19.77,70.56 19.77,77.42 ; 19.77,77.42 U14.1
  Bottom Layer w0.254: v1(85.43,65.6) v1(85.43,67.25) ; U16.5V 41.56,96.92 37.04,92.41 36.03,92.41 v1(33.23,89.61) ; v1(7.87,49.34) 9.65,49.34 v1(11.42,51.12) ; v1(20.41,22.04) 28.79,13.66 v1(29.04,13.66) 29.55,13.66 v1(30.57,12.64)
$1N5915: length 11.4
  Top Layer w0.254: U12.2 6.34,61.84 U13.4
$1N5955: length 44
  Top Layer w0.254: U2.4 72.19,92.82 67.48,92.82 66.97,92.31 31.16,92.31 U1.2
$1N6010: length 25.8
  Top Layer w0.254: U2.2 65.89,88.5 65.51,88.88 65.51,89.9 65.77,90.15 75.43,90.15 U3.4
$1N6017: length 16.8
  Top Layer w0.254: 91.75,68.94 89.33,71.36 v1(86.02,71.36) ; 78.91,78.47 v1(84.24,73.14)
  Bottom Layer w0.254: v1(84.24,73.14) v1(86.02,71.36)
$1N6025: length 18.1
  Top Layer w0.254: U5.4 86.84,61.44 86.84,65.64
$1N6060: length 18.4
  Top Layer w0.254: U6.4 91.79,29.96 U5.2
$1N6067: length 13.1
  Top Layer w0.254: U6.2 86.92,23.13 U7.4
$1N6075: length 14.4
  Top Layer w0.254: U7.2 69.47,13.04 U8.4
$1N6093: length 15.6
  Top Layer w0.254: U8.2 47.5,3.65 U9.4
$1N6102: length 22.9
  Top Layer w0.254: U10.4 20.47,13.04 23.69,13.04 33.08,3.65 U9.2
$1N6109: length 20.8
  Top Layer w0.254: U10.2 22.51,16.44 10.57,28.38 9.38,28.38
$1N6116: length 22
  Top Layer w0.254: v1(5.89,43.11) 5.89,43.88 U12.4 ; U11.2 7.16,38.79 v1(7.16,41.84)
  Bottom Layer w0.254: v1(7.16,41.84) v1(5.89,43.11)
$1N6127: length 13.4
  Top Layer w0.254: U14.4 10.41,73.03 U13.2
$1N6131: length 13.2
  Bottom Layer w0.254: CN1.1 92.95,49.13 SW1.3

## Copper pours and planes (outline as drawn; the poured copper is in the pictures)
GND on Top Layer: -2.96,100.67 101.18,100.67 101.18,-3.47 -2.96,-3.47
GND on Bottom Layer: -0.42,100.93 100.04,100.93 100.04,-1.82 -0.42,-1.82

Small or netless copper shapes (teardrops, artwork), in the pictures only: 12 on Bottom Layer

## Text on the board
Bottom Silkscreen Layer: GND | RX | MISO | MOSI | 5v | 3v3 | TX | CS | SCLK | B- | B+ | ON | OFF | 2026 | AHAU CTF | >> | << | Ich u kaxtaj óojel
